# Altium project AthletiTech_V1.0.PrjPcb (part 1 of 4)
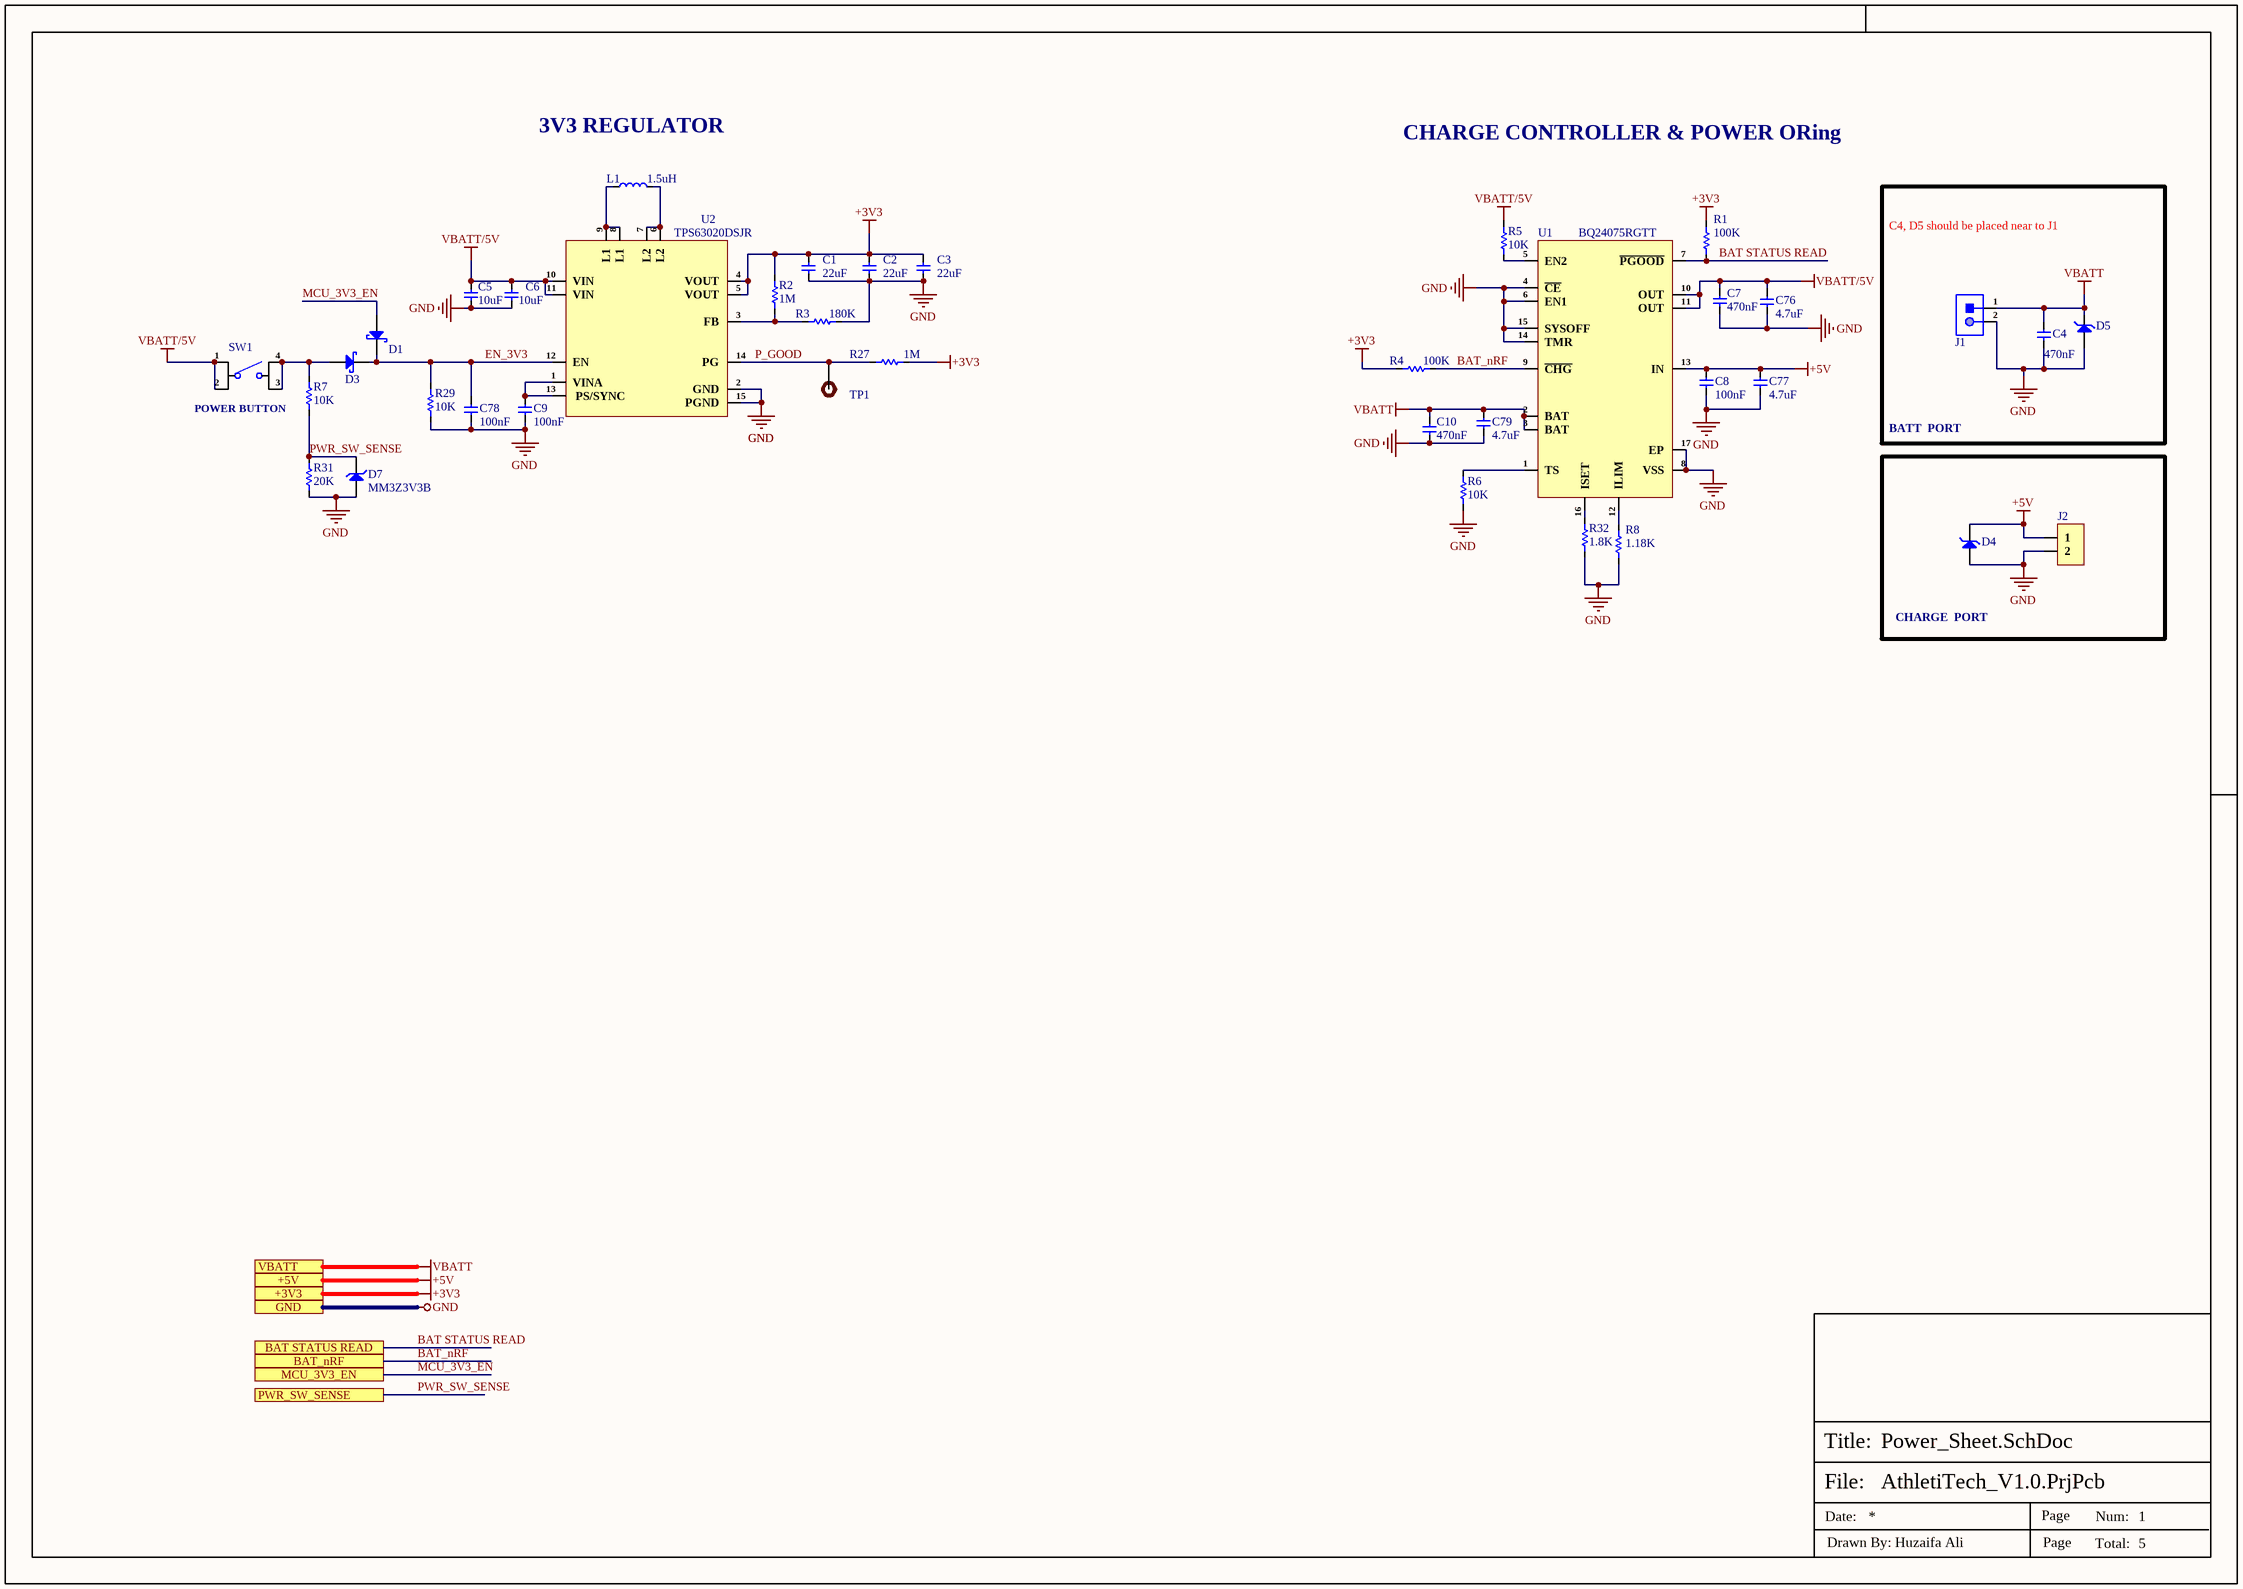
[diagram p0: Power_Sheet.SchDoc]
5 sheets, 178 parts. Net scope: flat (ports and power ports of the same name join across sheets).
Board file: AthetiTech_PCB_V1.0.PcbDoc
Sheets:
  Power_Sheet.SchDoc
  MCU_Sheet.SchDoc
  UWB_Sheet.SchDoc
  IMU_Sheet.SchDoc
  GPS_Sheet.SchDoc

## Sheet Power_Sheet.SchDoc
size 420 x 297 mm; SheetNumber: 1; SheetTotal: 5

### Parts
C1  22uF  [Cap-0603]
C2  22uF  [Cap-0603]
C3  22uF  [Cap-0603]
C4  470nF  [Cap-0402]
C5  10uF  [Cap-0603]
C6  10uF  [Cap-0603]
C7  470nF  [Cap-0402]
C8  100nF  [cap-0402]
C9  100nF  [cap-0402]
C10  470nF  [Cap-0402]
C76  4.7uF  [Cap-0402]
C77  4.7uF  [Cap-0402]
C78  100nF  [cap-0402]
C79  4.7uF  [Cap-0402]
D1  1SS404,H3F  [USC]  (value not drawn)
D3  1SS404,H3F  [USC]  (value not drawn)
D4  ESD9L5.0ST5G  [SOD-923.]  (value not drawn)
D5  ESD9L5.0ST5G  [SOD-923.]  (value not drawn)
D7  MM3Z3V3B  [SOD323F]
J1  S2B-ZR-3.4(LF)(SN)  [S2B-ZR-3.4(LF)(SN)]  (value not drawn)
J2  854-22-002-20-041101  [854-22-002-20-041101]  (value not drawn)
L1  1.5uH  [XFL4020-152MEC]
R1  100K  [Res-0402]
R2  1M  [Res-0402]
R3  180K  [Res-0402]
R4  100K  [Res-0402]
R5  10K  [Res-0402]
R6  10K  [Res-0402]
R7  10K  [Res-0402]
R8  1.18K  [Res-0402]
R27  1M  [Res-0402]
R29  10K  [Res-0402]
R31  20K  [Res-0402]
R32  1.8K  [Res-0402]
SW1  TS-1109S-C-B  [TS-1109S-C-B]  (value not drawn)
TP1  TEST POINT 0.5mm Dia  [Test-point - 0.5mm]  (value not drawn)  (no BOM)
U1  BQ24075RGTT  [VQFN-16(3x3)]
U2  TPS63020DSJR  [14-VSON (4x3)]

### Blocks framed on the sheet
CHARGE  PORT: D4 J2

### Ports
+3V3, +5V, BAT STATUS READ, BAT_nRF, GND, MCU_3V3_EN, PWR_SW_SENSE, VBATT

### Nets
+3V3: C1.2 C2.2 C3.2 R1.2 R2.2 R4.2 R27.1 U2.4(VOUT) U2.5(VOUT) ; port +3V3  [project net VDDAON]
+5V: C8.2 C77.2 D4.1(K) J2.1 U1.13(IN) ; port +5V
GND: C1.1 C2.1 C3.1 C4.2 C5.1 C6.1 C7.2 C8.1 C9.1 C10.2 C76.1 C77.1 C78.1 C79.1 D4.2(A) D5.2(A) D7.1(A) J1.2 J2.2 R3.1 R6.2 R8.1 R29.2 R31.1 R32.1 U1.4(~{CE}) U1.6(EN1) U1.8(VSS) U1.14(TMR) U1.15(SYSOFF) U1.17(EP) U2.2(GND) U2.15(PGND) ; port GND
VBATT: C4.1 C10.1 C79.2 D5.1(K) J1.1 U1.2(BAT) U1.3(BAT) ; port VBATT
VBATT/5V: C5.2 C6.2 C7.1 C76.2 R5.1 SW1.1 SW1.2 U1.10(OUT) U1.11(OUT) U2.10(VIN) U2.11(VIN)
BAT STATUS READ: R1.1 U1.7(~{PGOOD}) ; port BAT STATUS READ
BAT_nRF: R4.1 U1.9(~{CHG}) ; port BAT_nRF
EN_3V3: C78.2 D1.1(K) D3.1(K) R29.1 U2.12(EN)
MCU_3V3_EN: D1.2(A) ; port MCU_3V3_EN
P_GOOD: R27.2 TP1.1 U2.14(PG)
PWR_SW_SENSE: D7.2(K) R7.1 R31.2 ; port PWR_SW_SENSE
NetC9_2: C9.2 U2.1(VINA) U2.13(PS/SYNC)
NetD3_2: D3.2(A) R7.2 SW1.3 SW1.4
NetL1_1: L1.1 U2.8(L1) U2.9(L1)
NetL1_2: L1.2 U2.6(L2) U2.7(L2)
NetR2_1: R2.1 R3.2 U2.3(FB)
NetR5_2: R5.2 U1.5(EN2)
NetR6_1: R6.1 U1.1(TS)
NetR8_2: R8.2 U1.12(ILIM)
NetR32_2: R32.2 U1.16(ISET)

### Notes on the sheet
- (near L1) 3V3 REGULATOR
- CHARGE CONTROLLER & POWER ORing
- C4, D5 should be placed near to J1
- (near SW1) POWER BUTTON
- BATT  PORT
- File:
- Title:
- Date:
- Page
- Num:
- Total:
- Drawn By: Huzaifa Ali

### Library data of the parts
C1-C3 = CC0603MRX5R6BB226: CAP CER 22UF 10V X5R 0603; Manufacturer: Yageo; Tolerance: 20%; Item Type: Capacitor; Supplier 1: Digi-Key; Manufacturer Part Number: CC0603MRX5R6BB226; RoHS: Yes; Category: Ceramic Capacitors; Stock 1: 19628; Pricing 1: 1=0.68000, 10=0.48000, 50=0.36300, 100=0.31610, 500=0.23416, 1000=0.19903 (USD); Mount: Surface Mount; Case/Package: 0603; Case Code (Metric): 1608; Case Code (Imperial): 0603; Weight: 7.1E-05oz; Min Operating Temperature: -55°C; Max Operating Temperature: 85°C; Packaging: Tape and Reel; Capacitance: 22uF; Voltage Rating: 10V; Dielectric: X5R; Termination: SMD/SMT; Voltage Rating (DC): 10V; Package Quantity: 4000; Length: 0.063inch; Width: 0.8mm; Height: 0.8mm; Thickness: 0.035inch; Lead Free: Lead Free; Halogen Free: Halogen Free; RoHS Compliant: Yes; ComponentLink1URL: http://www.mouser.com/ds/2/447/Yageo_UPY-GP_NP0_16V-to-50V_9-358835.pdf?src-supplier=Mouser; ComponentLink1Description: http://www.mouser.com/ds/2/447/Yageo_UPY-GP_NP0_16V-to-50V_9-358835.pdf?src-supplier=Mouser; ComponentLink2URL: http://www.yageo.com/documents/recent/UPY-GPHC_X5R_4V-to-50V_25.pdf?src-supplier=Digi-Key; ComponentLink2Description: http://www.yageo.com/documents/recent/UPY-GPHC_X5R_4V-to-50V_25.pdf?src-supplier=Digi-Key; Supplier Part Number 1: 311-1819-1-ND; LCSC Part Number: C109447
C4 C7 C10 = CL05A474KA5NNNC: CAP CER 0.47UF 25V X5R 0402; Manufacturer: Samsung; Material: Ceramic; Tolerance: 10%; Supplier: Avnet; Supplier Part Number: CL05A474KA5NNNC; Manufacturer Part Number: CL05A474KA5NNNC; RoHS: Yes; Category: Ceramic Capacitors; Stock: 80000; Pricing: 100000=0.02563 (USD); Mounting Technology: Surface Mount; Case/Package: 0402; Case Code (Metric): 1005; Case Code (Imperial): 0402; Min Operating Temperature: -55°C; Max Operating Temperature: 85°C; Packaging: Cut Tape; Value: 470nF; Voltage Rating (DC): 25V; Voltage Rating: 25V; Series: CL; Height: 550um; Lead Free: Lead Free; RoHS Compliant: Yes; ComponentLink1URL: https://datasheet.ciiva.com/25796/cl05a474ka5nnnc-25796037.pdf?src-supplier=Digikey; ComponentLink1Description: https://datasheet.ciiva.com/25796/cl05a474ka5nnnc-25796037.pdf?src-supplier=Digikey; ComponentLink2URL: https://datasheet.ciiva.com/29198/458859-da-01-en-vs-kondensator-0402-29198303.pdf?src-supplier=Conrad; ComponentLink2Description: https://datasheet.ciiva.com/29198/458859-da-01-en-vs-kondensator-0402-29198303.pdf?src-supplier=Conrad
C5 C6 = GRT188R61E106ME13D: CAP CER 10UF 25V X5R 0603; Manufacturer: Murata; Item Type: Capacitors; Material: 4241ConductorMaterial; Tolerance: 20%; Supplier: Future Electronics; LCSC Part Number: C697423; Manufacturer Part Number: GRT188R61E106ME13D; RoHS: No; Stock: 444000; Pricing: 4000=0.0522, 8000=0.0514, 12000=0.0509, 20000=0.0503, 40000=0.049 (USD); Mounting Technology: Surface Mount; Case/Package: 0603; Case Code (Metric): 1608; Case Code (Imperial): 0603; Weight: 0.000917oz; Min Operating Temperature: -55°C; Max Operating Temperature: 85°C; Packaging: Cut Tape; Value: 10uF; Voltage Rating: 25V; Series: GRT; Termination: Standard; Voltage Rating (DC): 25V; Dielectric: X5R; Package Quantity: 4000; Length: 1.6mm; Width: 0.8mm; Height: 0.8mm; Ratings: AEC-Q200; RoHS Compliant: No; ComponentLink1URL: https://datasheet.octopart.com/GRT188R61E106ME13D-Murata-datasheet-149523595.pdf?src-supplier=Newark; ComponentLink1Description: https://datasheet.octopart.com/GRT188R61E106ME13D-Murata-datasheet-149523595.pdf?src-supplier=Newark; ComponentLink2URL: https://datasheet.octopart.com/GRT188R61E106ME13D-Murata-datasheet-82944876.pdf?src-supplier=Future+Electronics; ComponentLink2Description: https://datasheet.octopart.com/GRT188R61E106ME13D-Murata-datasheet-82944876.pdf?src-supplier=Future+Electronics; ComponentLink3URL: http://search.murata.co.jp/Ceramy/image/img/A01X/G101/ENG/GRT188R61E106ME13-01.pdf?src-supplier=Digikey; ComponentLink3Description: http://search.murata.co.jp/Ceramy/image/img/A01X/G101/ENG/GRT188R61E106ME13-01.pdf?src-supplier=Digikey; ComponentLink4URL: https://search.murata.co.jp/Ceramy/image/img/A01X/G101/ENG/GRT188R61E106ME13-01.pdf?src-supplier=Digikey; ComponentLink4Description: https://search.murata.co.jp/Ceramy/image/img/A01X/G101/ENG/GRT188R61E106ME13-01.pdf?src-supplier=Digikey; ComponentLink5URL: https://datasheet.octopart.com/GRT188R61E106ME13D-Murata-datasheet-165579666.pdf?src-supplier=TME; ComponentLink5Description: https://datasheet.octopart.com/GRT188R61E106ME13D-Murata-datasheet-165579666.pdf?src-supplier=TME
C8 C9 C78 = C1005X7R1H104KT000F: CAP CER 0.1UF 50V X7R 0402; Manufacturer: TDK; Tolerance: 10%; Voltage: 25V; Item Type: Capacitor; Supplier 1: Avnet; Manufacturer Part Number: C1005X7R1H104KT000F; RoHS: No; Category: Ceramic Capacitors; Dielectric: X7R; Supplier Part Number 1: C1005X7R1H104KT000F; LCSC Part Number: C361198; ComponentLink1Description: LCSC; ComponentLink1URL: https://www.lcsc.com/product-detail/Multilayer-Ceramic-Capacitors-MLCC-SMD-SMT_TDK-C1005X7R1H104KT000F_C361198.html
C76 C77 C79 = CL05A475MO5NUNC: CAP CER 4.7UF 16V X5R 0402; Manufacturer: Samsung; Material: 4241ConductorMaterial; Tolerance: 20%; Supplier 1: Avnet; Manufacturer Part Number: CL05A475MO5NUNC; RoHS: Yes; Category: Ceramic Capacitors; Stock 1: 50000; Pricing 1: 10000=0.09712 (USD); Mount: Surface Mount; Case/Package: 0402; Case Code (Metric): 1005; Case Code (Imperial): 0402; Min Operating Temperature: -55°C; Max Operating Temperature: 85°C; Packaging: Cut Tape; Capacitance: 4.7uF; Voltage Rating: 16V; Series: CL; Voltage Rating (DC): 16V; Length: 0.039inch; Width: 0.02inch; Height: 550um; Thickness: 0.022inch; RoHS Compliant: Yes; ComponentLink1URL: http://www.farnell.com/datasheets/2710653.pdf?src-supplier=Farnell; ComponentLink1Description: http://www.farnell.com/datasheets/2710653.pdf?src-supplier=Farnell; ComponentLink2URL: http://www.samsungsem.com/kr/support/product-search/mlcc/CL05A475MO5NUNC.jsp?src-supplier=Digikey; ComponentLink2Description: http://www.samsungsem.com/kr/support/product-search/mlcc/CL05A475MO5NUNC.jsp?src-supplier=Digikey; ComponentLink3URL: http://www.farnell.com/datasheets/2710653.pdf?src-supplier=Element14; ComponentLink3Description: http://www.farnell.com/datasheets/2710653.pdf?src-supplier=Element14; ComponentLink4URL: https://datasheet.octopart.com/CL05A475MO5NUNC-Samsung-Electro-Mechanics-datasheet-123102911.pdf?src-supplier=Future+Electronics; ComponentLink4Description: https://datasheet.octopart.com/CL05A475MO5NUNC-Samsung-Electro-Mechanics-datasheet-123102911.pdf?src-supplier=Future+Electronics; ComponentLink5URL: http://www.farnell.com/datasheets/2710653.pdf?src-supplier=Newark; ComponentLink5Description: http://www.farnell.com/datasheets/2710653.pdf?src-supplier=Newark; Supplier Part Number 1: CL05A475MO5NUNC
D1 D3 = 1SS404,H3F: Diode Schottky Barrier 25V 0.3A 2 SOD-323; Manufacturer: Toshiba; Average Rectified Current: 300mA; Max Reverse Voltage (DC): 20V; Supplier 1: Avnet; Manufacturer Part Number: 1SS404,H3F; RoHS: No; Category: Rectifier Diodes; Stock 1: 36000; Pricing 1: 3000=0.01778, 6000=0.01748, 12000=0.01718, 18000=0.01688, 24000=0.01658 (USD); Mount: Surface Mount; Case/Package: SOD; Contact Plating: Tin,Silver; Min Operating Temperature: -40°C; Max Operating Temperature: 100°C; Packaging: Cut Tape; Forward Current: 300mA; Max Repetitive Reverse Voltage (Vrrm): 25V; Series: -; ComponentLink1URL: https://datasheet.ciiva.com/45259/dst-1ss404-tde-en-1850-45259189.pdf?src-supplier=Digikey; ComponentLink1Description: https://datasheet.ciiva.com/45259/dst-1ss404-tde-en-1850-45259189.pdf?src-supplier=Digikey; ComponentLink2URL: https://datasheet.ciiva.com/45259/dst-1ss404-tde-en-1850-45259190.pdf?src-supplier=Digikey; ComponentLink2Description: https://datasheet.ciiva.com/45259/dst-1ss404-tde-en-1850-45259190.pdf?src-supplier=Digikey; ComponentLink3URL: https://datasheet.ciiva.com/45259/dst-1ss404-tde-en-1850-45259191.pdf?src-supplier=Digikey; ComponentLink3Description: https://datasheet.ciiva.com/45259/dst-1ss404-tde-en-1850-45259191.pdf?src-supplier=Digikey; Supplier Part Number 1: 1SS404,H3F; Item Type: Diode; LCSC Part Number: C146358
D4 D5 = ESD9L5.0ST5G: TVS DIODE 5V 9.8V SOD923; Manufacturer: ON Semiconductor; Capacitance: 0.9pF; Direction: Unidirectional; Number of Unidirectional Channels: 1; Min Breakdown Voltage: 5.4V; Power Line Protection: No; Leakage Current: 1uA; Element Configuration: Single; Peak Pulse Current: 1A; Diode Type: ZENER; Reverse Breakdown Voltage: 5.8V; Peak Pulse Power: 150mW; ESD Protection: Yes; Test Current: 1mA; Supplier 1: Digi-Key; Manufacturer Part Number: ESD9L5.0ST5G; RoHS: Yes; Category: ESD and Circuit Protection ICs; Stock 1: 558996; Pricing 1: 1=0.37000, 10=0.25600, 100=0.12500, 500=0.10426, 1000=0.07244, 2000=0.06278 (USD); Case/Package: SOD-923-2; Number of Pins: 2; Contact Plating: Tin,Matte; Min Operating Temperature: -55°C; Max Operating Temperature: 150°C; Package Quantity: 1; Packaging: Tape and Reel; Clamping Voltage: 9.8V; Reverse Standoff Voltage: 5V; Working Voltage: 5V; Resistor Type: Zener; Series: Automotive, AEC-Q101; Number of Elements: 1; Operating Supply Voltage: 5V; Max Surge Current: 1A; Breakdown Voltage: 5.4V; Number of Channels: 1; Polarity: Unidirectional; Termination: SMD/SMT; Max Reverse Leakage Current: 1uA; Max Breakdown Voltage: 5.4V; Number of Lines: 1; Power Dissipation: 150mW; Clamping Voltage-Max: 9.8V; Length: 0.8mm; Width: 0.65mm; Height: 0.4mm; Depth: 0.6mm; Radiation Hardening: No; Lead Free: Lead Free; RoHS Compliant: Yes; REACH SVHC: No SVHC; Halogen Free: Halogen Free; ComponentLink1URL: https://datasheet.ciiva.com/15143/getdatasheetpartid-185186-15143896.pdf?src-supplier=Verical; ComponentLink1Description: https://datasheet.ciiva.com/15143/getdatasheetpartid-185186-15143896.pdf?src-supplier=Verical; ComponentLink2URL: https://datasheet.ciiva.com/4510/esd9l-d-4510647.pdf?src-supplier=Mouser; ComponentLink2Description: https://datasheet.ciiva.com/4510/esd9l-d-4510647.pdf?src-supplier=Mouser; ComponentLink3URL: https://datasheet.ciiva.com/3304/esd9l-d-3304011.pdf?src-supplier=Avnet; ComponentLink3Description: https://datasheet.ciiva.com/3304/esd9l-d-3304011.pdf?src-supplier=Avnet; ComponentLink4URL: https://datasheet.ciiva.com/16437/esd9l-d-16437835.pdf?src-supplier=Future+Electronics; ComponentLink4Description: https://datasheet.ciiva.com/16437/esd9l-d-16437835.pdf?src-supplier=Future+Electronics; ComponentLink5URL: https://datasheet.ciiva.com/339/esd9l-d-339853.pdf?src-supplier=Digi-Key; ComponentLink5Description: https://datasheet.ciiva.com/339/esd9l-d-339853.pdf?src-supplier=Digi-Key; ComponentLink6URL: https://datasheet.ciiva.com/339/esd9l-d-339854.pdf?src-supplier=Digi-Key; ComponentLink6Description: https://datasheet.ciiva.com/339/esd9l-d-339854.pdf?src-supplier=Digi-Key; ComponentLink7URL: https://datasheet.ciiva.com/11195/esd9l-d-11195342.pdf?src-supplier=Avnet; ComponentLink7Description: https://datasheet.ciiva.com/11195/esd9l-d-11195342.pdf?src-supplier=Avnet; ComponentLink8URL: https://datasheet.ciiva.com/25958/esd9l-d-25958446.pdf?src-supplier=Avnet+Europe; ComponentLink8Description: https://datasheet.ciiva.com/25958/esd9l-d-25958446.pdf?src-supplier=Avnet+Europe; ComponentLink9URL: https://datasheet.ciiva.com/339/esd9l-d-339855.pdf?src-supplier=Digi-Key; ComponentLink9Description: https://datasheet.ciiva.com/339/esd9l-d-339855.pdf?src-supplier=Digi-Key; Supplier Part Number 1: ESD9L5.0ST5GOSCT-ND; LCSC Part Number: C82326
D7 = MM3Z3V3B: DIODE ZENER 3.3V 200MW SOD323F; Manufacturer: ON Semiconductor / Fairchild; Forward Voltage: 1V; Tolerance: 2%; Impedance: 89R; Max Reverse Leakage Current: 4.5uA; Test Current: 5mA; Element Configuration: Single; Supplier 1: Digi-Key; Manufacturer Part Number: MM3Z3V3B; Stock 1: 473644; Pricing 1: 1=0.22, 10=0.18, 100=0.0956, 500=0.06288, 1000=0.04276 (USD); Mount: Surface Mount; Number of Pins: 2; Weight: 0.0276g; Min Operating Temperature: -65°C; Max Operating Temperature: 150°C; Packaging: Tape and Reel; Package Quantity: 1; Max Power Dissipation: 200mW; Zener Voltage: 3.3V; Voltage Tolerance: 2%; Power Dissipation: 200mW; Working Voltage: 3.3V; Peak Reverse Current: 4.5uA; Length: 1.3mm; Height: 1mm; Width: 1.7mm; Radiation Hardening: No; REACH SVHC: No SVHC; Lead Free: Lead Free; ComponentLink1URL: http://www.onsemi.com/pub/Collateral/MM3Z9V1B-D.pdf?src-supplier=Digi-Key; ComponentLink1Description: http://www.onsemi.com/pub/Collateral/MM3Z9V1B-D.pdf?src-supplier=Digi-Key; ComponentLink2URL: http://www.mouser.com/ds/2/149/MM3Z3V3B-187166.pdf?src-supplier=Mouser; ComponentLink2Description: http://www.mouser.com/ds/2/149/MM3Z3V3B-187166.pdf?src-supplier=Mouser; ComponentLink3URL: https://www.fairchildsemi.com/datasheets/MM/MM3Z9V1B.pdf?src-supplier=Avnet; ComponentLink3Description: https://www.fairchildsemi.com/datasheets/MM/MM3Z9V1B.pdf?src-supplier=Avnet; ComponentLink4URL: http://www.farnell.com/datasheets/1706525.pdf?src-supplier=Element14; ComponentLink4Description: http://www.farnell.com/datasheets/1706525.pdf?src-supplier=Element14; Supplier Part Number 1: MM3Z3V3BCT-ND; LCSC Part Number: C2978865; Item Type: Diode
J1 = S2B-ZR-3.4(LF)(SN): CONN HEADER R/A 2POS 1.5MM; Manufacturer: JST; Item Type: Connectors; Supplier: Future Electronics; LCSC Part Number: C160729; Manufacturer Part Number: S2B-ZR-3.4(LF)(SN); RoHS: Yes; Pricing: 2000=0.0671, 4000=0.0659, 8000=0.0648, 10000=0.0645, 30000=0.0623 (USD)
J2 = 854-22-002-20-041101: 2 Position Spring Piston Connector Through Hole, Right Angle; Manufacturer: Mill-Max; Item Type: Spring Loaded; Supplier: Digikey; Supplier Part Number: 54-854-22-002-20-041101-ND; Manufacturer Part Number: 854-22-002-20-041101; RoHS: No; Pricing: 1=3.53, 10=3.002, 25=2.8136, 50=2.679, 100=2.551, 250=2.39124, 500=2.27716, 1000=2.16851, 2500=2.03287 (USD)
L1 = XFL4020-152MEC: FIXED IND 1.5UH 9.1A 15.8MOHM SM; Manufacturer: Coilcraft; Item Type: Inductors; ESR: 15.8mR; Supplier: Mouser; LCSC Part Number: C3033018; Manufacturer Part Number: XFL4020-152MEC; RoHS: Yes; Stock: 9871; Pricing: 1=3.04, 10=2.59, 50=2.39, 100=1.78, 1000=1.23, 10000=1.23 (USD); ComponentLink1URL: https://datasheet.ciiva.com/13168/xfl4020-13168080.pdf?src-supplier=Mouser; ComponentLink1Description: https://datasheet.ciiva.com/13168/xfl4020-13168080.pdf?src-supplier=Mouser; ComponentLink2URL: https://datasheet.ciiva.com/22679/1682010-22679275.pdf?src-supplier=Element14; ComponentLink2Description: https://datasheet.ciiva.com/22679/1682010-22679275.pdf?src-supplier=Element14; ComponentLink3URL: https://datasheet.ciiva.com/22679/1682010-22679276.pdf?src-supplier=Element14; ComponentLink3Description: https://datasheet.ciiva.com/22679/1682010-22679276.pdf?src-supplier=Element14
R1 R4 = RC0402FR-07100KL: RES 100K OHM 1% 1/16W 0402; Manufacturer: Yageo; Resistance: 100kR; Temperature Coefficient: 100ppm/°C; Power Rating: 63mW; Voltage Rating: 50V; Item Type: Resistor; Supplier 1: Mouser; Manufacturer Part Number: RC0402FR-07100KL; RoHS: Yes; Category: Chip SMD Resistors; Stock 1: 7759549; Pricing 1: 1=0.10000, 10=0.01200, 50=0.01200, 100=0.00500, 1000=0.00300, 2500=0.00200, 10000=0.00100 (USD); Case/Package: 0402; Case Code (Metric): 1005; Case Code (Imperial): 0402; Min Operating Temperature: -55°C; Max Operating Temperature: 155°C; Resistor Type: Thick Film; Tolerance: 1%; Packaging: Tape and Reel; Package Quantity: 1; Number of Terminations: 2; Termination: SMD/SMT; Max Power Dissipation: 63mW; Working Voltage: 50V; Features: Moisture Resistant; Series: RC; Resistance Tolerance: 1%; Construction: Rectangular; Technology: THICK FILM; Length: 0.039inch; Width: 0.02inch; Height: 0.016inch; Depth: 0.5mm; REACH SVHC: No SVHC; Lead Free: Lead Free; RoHS Compliant: Yes; Military Standard: Not; ComponentLink1URL: https://datasheet.ciiva.com/11819/0900766b80c66297-11819452.pdf?src-supplier=RSComponents; ComponentLink1Description: https://datasheet.ciiva.com/11819/0900766b80c66297-11819452.pdf?src-supplier=RSComponents; ComponentLink2URL: https://datasheet.ciiva.com/22747/1018594-22747509.pdf?src-supplier=Element14; ComponentLink2Description: https://datasheet.ciiva.com/22747/1018594-22747509.pdf?src-supplier=Element14; ComponentLink3URL: https://datasheet.ciiva.com/2453/pyu-r-int-thick-7-2453362.pdf?src-supplier=Digi-Key; ComponentLink3Description: https://datasheet.ciiva.com/2453/pyu-r-int-thick-7-2453362.pdf?src-supplier=Digi-Key; ComponentLink4URL: https://datasheet.ciiva.com/2453/pyu-r-int-thick-7-2453363.pdf?src-supplier=Digi-Key; ComponentLink4Description: https://datasheet.ciiva.com/2453/pyu-r-int-thick-7-2453363.pdf?src-supplier=Digi-Key; ComponentLink5URL: https://datasheet.ciiva.com/2453/pyu-r-int-thick-7-2453361.pdf?src-supplier=Digi-Key; ComponentLink5Description: https://datasheet.ciiva.com/2453/pyu-r-int-thick-7-2453361.pdf?src-supplier=Digi-Key; ComponentLink6URL: https://datasheet.ciiva.com/12667/pyu-rc0402-51-rohs-l-6-r-12667930.pdf?src-supplier=Mouser; ComponentLink6Description: https://datasheet.ciiva.com/12667/pyu-rc0402-51-rohs-l-6-r-12667930.pdf?src-supplier=Mouser; ComponentLink7URL: https://datasheet.ciiva.com/15189/getdatasheetpartid-323696-15189334.pdf?src-supplier=Verical; ComponentLink7Description: https://datasheet.ciiva.com/15189/getdatasheetpartid-323696-15189334.pdf?src-supplier=Verical; Supplier Part Number 1: 603-RC0402FR-07100KL; LCSC Part Number: C60491
R2 R27 = AF0402JR-071ML: RES SMD 1M OHM 5% 1/16W 0402; Manufacturer: Yageo; Resistance: 1MR; Max Power Dissipation: 63mW; Temperature Coefficient: 100ppm/°C; Item Type: Resistor; Supplier 1: Digi-Key; Manufacturer Part Number: AF0402JR-071ML; Stock 1: 0; Pricing 1: 10000=0.00408 (USD); Case/Package: 0402; Min Operating Temperature: -55°C; Max Operating Temperature: 155°C; Packaging: Tape and Reel; Resistor Type: Thick Film; Number of Terminations: 2; Tolerance: 5%; Features: Moisture Resistant,Anti-Sulfur; Length: 0.039inch; Width: 0.02inch; Height: 0.015inch; RoHS Compliant: Yes; ComponentLink1URL: https://www.yageo.com/upload/media/product/productsearch/datasheet/rchip/PYu-AF_51_RoHS_L_6.pdf?src-supplier=Digi-Key; ComponentLink1Description: https://www.yageo.com/upload/media/product/productsearch/datasheet/rchip/PYu-AF_51_RoHS_L_6.pdf?src-supplier=Digi-Key; Supplier Part Number 1: AF0402JR-071ML-ND; LCSC Part Number: C144054
R3 = RT0402BRD07180KL: RES 180K OHM 0.1% 1/16W 0402; Manufacturer: Yageo; Value: 180kR; Max Power Dissipation: 63mW; Temperature Coefficient: 25ppm/°C; Item Type: Resistor; Supplier: Mouser; Supplier Part Number: 603-RT0402BRD07180KL; Manufacturer Part Number: RT0402BRD07180KL; RoHS: Yes; Category: Chip SMD Resistors; Stock: 23360; Pricing: 1=0.44, 10=0.324, 50=0.324, 100=0.129, 1000=0.064, 10000=0.051 (USD); Case/Package: 0402; Min Operating Temperature: -55°C; Max Operating Temperature: 155°C; Packaging: Tape and Reel; Tolerance: 0.1%; Number of Terminations: 2; Series: RT; RoHS Compliant: Yes; ComponentLink1URL: http://www.yageo.com/documents/recent/PYu-RT_1-to-0.01_RoHS_L_9.pdf?src-supplier=Digi-Key; ComponentLink1Description: http://www.yageo.com/documents/recent/PYu-RT_1-to-0.01_RoHS_L_9.pdf?src-supplier=Digi-Key; LCSC Part Number: C852573
R5 R6 R29 = RC0402FR-0710KL: RES 10K OHM 1% 1/16W 0402; Manufacturer: Yageo; Resistance: 10kR; Voltage Rating (DC): 50V; Temperature Coefficient: 100ppm/°C; Power Rating: 62.5mW; Max Power Dissipation: 63mW; Item Type: Resistor; Supplier 1: Mouser; Manufacturer Part Number: RC0402FR-0710KL; RoHS: Yes; Category: Chip SMD Resistors; Stock 1: 18648329; Pricing 1: 1=0.10000, 10=0.01400, 50=0.01400, 100=0.00500, 1000=0.00300, 10000=0.00200 (USD); Case/Package: 0402; Number of Pins: 2; Case Code (Imperial): 0402; Case Code (Metric): 1005; Min Operating Temperature: -55°C; Max Operating Temperature: 155°C; Resistor Type: Thick Film; Tolerance: 1%; Packaging: Tape and Reel; Voltage Rating: 50V; Termination: SMD/SMT; Working Voltage: 50V; Number of Terminations: 2; Features: Moisture Resistant; Series: RC; Resistance Tolerance: 1%; Construction: Rectangular; Length: 1mm; Width: 0.5mm; Height: 0.32mm; Depth: 0.5mm; Lead Pitch: 0.2mm; REACH SVHC: No SVHC; Lead Free: Lead Free; RoHS Compliant: Yes; Military Standard: Not; ComponentLink1URL: https://datasheet.ciiva.com/7660/38568-7660787.pdf?src-supplier=Element14; ComponentLink1Description: https://datasheet.ciiva.com/7660/38568-7660787.pdf?src-supplier=Element14; ComponentLink2URL: https://datasheet.ciiva.com/7849/1686128-7849814.pdf?src-supplier=Element14; ComponentLink2Description: https://datasheet.ciiva.com/7849/1686128-7849814.pdf?src-supplier=Element14; ComponentLink3URL: https://datasheet.ciiva.com/7983/1018594-7983486.pdf?src-supplier=Element14; ComponentLink3Description: https://datasheet.ciiva.com/7983/1018594-7983486.pdf?src-supplier=Element14; ComponentLink4URL: https://datasheet.ciiva.com/22747/1018594-22747512.pdf?src-supplier=Element14; ComponentLink4Description: https://datasheet.ciiva.com/22747/1018594-22747512.pdf?src-supplier=Element14; ComponentLink5URL: https://datasheet.ciiva.com/12667/pyu-rc0402-51-rohs-l-6-r-12667067.pdf?src-supplier=Mouser; ComponentLink5Description: https://datasheet.ciiva.com/12667/pyu-rc0402-51-rohs-l-6-r-12667067.pdf?src-supplier=Mouser; ComponentLink6URL: https://datasheet.ciiva.com/7849/1784430-7849813.pdf?src-supplier=Element14; ComponentLink6Description: https://datasheet.ciiva.com/7849/1784430-7849813.pdf?src-supplier=Element14; ComponentLink7URL: https://datasheet.ciiva.com/7849/1784430-7849815.pdf?src-supplier=Element14; ComponentLink7Description: https://datasheet.ciiva.com/7849/1784430-7849815.pdf?src-supplier=Element14; Supplier Part Number 1: 603-RC0402FR-0710KL; LCSC Part Number: C60490
R7 = RE0402DRE0710KL: RES SMD 10K OHM 0.5% 1/16W 0402; Manufacturer: Yageo; Value: 10kR; Max Power Dissipation: 63mW; Temperature Coefficient: 50ppm/°C; Item Type: Resistor; Supplier: Future Electronics; Supplier Part Number: 8132697; Manufacturer Part Number: RE0402DRE0710KL; RoHS: Yes; Category: Chip SMD Resistors; Stock: 10000; Pricing: 10000=0.0059, 40000=0.0056, 150000=0.0053, 250000=0.0052, 500000=0.0049 (USD); Case/Package: 0402; Min Operating Temperature: -55°C; Max Operating Temperature: 155°C; Packaging: Tape and Reel; Number of Terminations: 2; Tolerance: 0.5%; Features: Moisture Resistant; Series: RE; Length: 0.039inch; Width: 0.02inch; Height: 0.015inch; RoHS Compliant: Yes; ComponentLink1URL: http://www.yageo.com/NewPortal/yageodocoutput?fileName=/pdf/R-Chip/PYu-RE_105_RoHS_L_6.pdf&src-supplier=Digi-Key; ComponentLink1Description: http://www.yageo.com/NewPortal/yageodocoutput?fileName=/pdf/R-Chip/PYu-RE_105_RoHS_L_6.pdf&src-supplier=Digi-Key; LCSC Part Number: C851874
R8 = RT0402BRD071K18L: RES SMD 1.18KOHM 0.1% 1/16W 0402; Manufacturer: Yageo; Item Type: Resistors; Supplier: Avnet; LCSC Part Number: C852601; Manufacturer Part Number: RT0402BRD071K18L; RoHS: Yes; Stock: 10000; Pricing: 10000=0.01384 (USD); ComponentLink1URL: https://datasheet.ciiva.com/2582/pyu-rt-1-to-0-05-rohs-l-4-2582193.pdf?src-supplier=Digikey; ComponentLink1Description: https://datasheet.ciiva.com/2582/pyu-rt-1-to-0-05-rohs-l-4-2582193.pdf?src-supplier=Digikey; ComponentLink2URL: https://datasheet.ciiva.com/46635/pyu-rt-1-to-0-05-rohs-l-5-46635161.pdf?src-supplier=Digikey; ComponentLink2Description: https://datasheet.ciiva.com/46635/pyu-rt-1-to-0-05-rohs-l-5-46635161.pdf?src-supplier=Digikey
R31 = RT0402BRD0720KL: RES SMD 20K OHM 0.1% 1/16W 0402; Manufacturer: Yageo; Value: 20kR; Power Rating: 62.5mW; Voltage Rating: 50V; Max Power Dissipation: 63mW; Temperature Coefficient: 25ppm/°C; Item Type: Resistor; Supplier: Digikey; Supplier Part Number: YAG1388CT-ND; Manufacturer Part Number: RT0402BRD0720KL; RoHS: Yes; Category: Chip SMD Resistors; Stock: 80617; Pricing: 1=0.16, 10=0.121, 50=0.0958, 100=0.0859, 500=0.0654, 1000=0.0578, 5000=0.04283 (USD); Case/Package: 0402; Case Code (Imperial): 0402; Case Code (Metric): 1005; Weight: 2.3E-05oz; Contact Plating: Tin,Matte; Min Operating Temperature: -55°C; Max Operating Temperature: 125°C; Packaging: Tape and Reel; Tolerance: 0.1%; Package Quantity: 10000; Number of Terminations: 2; Termination: SMD/SMT; Voltage Rating (DC): 50V; Features: Moisture Resistant; Series: RT; Length: 0.039inch; Width: 0.5mm; Height: 0.014inch; Lead Free: Lead Free; RoHS Compliant: Yes; ComponentLink1URL: https://datasheet.ciiva.com/8890/pyu-rt-1-to-0-05-rohs-l-4-8890380.pdf?src-supplier=Avnet; ComponentLink1Description: https://datasheet.ciiva.com/8890/pyu-rt-1-to-0-05-rohs-l-4-8890380.pdf?src-supplier=Avnet; LCSC Part Number: C705630
R32 = RCS04021K80FKED: RES SMD 1.8K OHM 1% 1/5W 0402; Manufacturer: Vishay Dale; Resistance: 1.8kR; Max Power Dissipation: 200mW; Temperature Coefficient: 100ppm/°C; Supplier 1: Digi-Key; Manufacturer Part Number: RCS04021K80FKED; Stock 1: 1940; Pricing 1: 1=0.12, 10=0.105, 100=0.0402, 1000=0.01771, 2500=0.0153, 5000=0.01368 (USD); Case/Package: 0402; Min Operating Temperature: -55°C; Max Operating Temperature: 155°C; Package Quantity: 10000; Packaging: Tape and Reel; Resistor Type: Thick Film; Number of Terminations: 2; Tolerance: 1%; Features: Automotive AEC-Q200; Length: 0.039inch; Width: 0.02inch; Height: 0.016inch; ComponentLink1URL: http://www.vishay.com/docs/20065/rcse3.pdf?src-supplier=Digi-Key; ComponentLink1Description: http://www.vishay.com/docs/20065/rcse3.pdf?src-supplier=Digi-Key; Supplier Part Number 1: 541-RCS04021K80FKEDDKR-ND; LCSC Part Number: C1881088
SW1 = TS-1109S-C-B: No NO 50mA 4.5mm 100000 260gf 12V -30℃~+85℃ 4.5mm 4.3mm Black Round Button Brick nogging SPST SMD Tactile Switches ROHS; Manufacturer: XKB Connectivity; Item Type: Switch; Manufacturer Part Number: TS-1109S-C-B; Package: Custom; LCSC Part Number: C381037; ComponentLink1Description: LCSC; ComponentLink1URL: https://www.lcsc.com/product-detail/Tactile-Switches_XKB-Connectivity-TS-1109S-C-B_C381037.html
TP1 = TEST POINT 0.5mm Dia: Test Point ON; Item Type: Test Point; Manufacturer Part Number: TEST POINT 0.5mm Dia
U1 = BQ24075RGTT: IC BATT CHG LI-ION 1CELL 16QFN; Manufacturer: Texas Instruments; Supplier: Mouser; LCSC Part Number: C2865459; Manufacturer Part Number: BQ24075RGTT; RoHS: Yes; Item Type: IC; Stock: 350; Pricing: 1=2.63, 10=1.96, 50=1.8, 100=1.61, 1000=1.38, 10000=1.3 (USD); ComponentLink1URL: https://datasheet.ciiva.com/15114/getdatasheetpartid-313264-15114609.pdf?src-supplier=Verical; ComponentLink1Description: https://datasheet.ciiva.com/15114/getdatasheetpartid-313264-15114609.pdf?src-supplier=Verical; ComponentLink2URL: https://datasheet.ciiva.com/1932/bq24072-1932354.pdf?src-supplier=Digikey; ComponentLink2Description: https://datasheet.ciiva.com/1932/bq24072-1932354.pdf?src-supplier=Digikey; ComponentLink3URL: https://datasheet.ciiva.com/1932/bq24072-1932355.pdf?src-supplier=Digikey; ComponentLink3Description: https://datasheet.ciiva.com/1932/bq24072-1932355.pdf?src-supplier=Digikey; ComponentLink4URL: https://datasheet.ciiva.com/1932/bq24072-1932356.pdf?src-supplier=Digikey; ComponentLink4Description: https://datasheet.ciiva.com/1932/bq24072-1932356.pdf?src-supplier=Digikey; ComponentLink5URL: https://datasheet.ciiva.com/3214/bq24079-3214045.pdf?src-supplier=Avnet; ComponentLink5Description: https://datasheet.ciiva.com/3214/bq24079-3214045.pdf?src-supplier=Avnet; ComponentLink6URL: https://datasheet.ciiva.com/1136/1857100-1136583.pdf?src-supplier=Element14; ComponentLink6Description: https://datasheet.ciiva.com/1136/1857100-1136583.pdf?src-supplier=Element14; ComponentLink7URL: https://datasheet.ciiva.com/46397/1885912-46397205.pdf?src-supplier=Element14; ComponentLink7Description: https://datasheet.ciiva.com/46397/1885912-46397205.pdf?src-supplier=Element14
U2 = TPS63020DSJR: IC REG BUCK-BST ADJ 3.5A 14VSON; Manufacturer: Texas Instruments; Min Supply Voltage: 1.8V; Number of Outputs: 1; Output Voltage: 5.5V; Output Current: 3A; Efficiency: 96%; Switching Frequency: 2.4MHz; Min Output Voltage: 1.2V; Synchronous Rectifier: Yes; Quiescent Current: 50uA; Topology: Buck-Boost; Output Type: Adjustable; Output Configuration: Positive; Supplier: Mouser; Supplier Part Number: 595-TPS63020DSJR; Manufacturer Part Number: TPS63020DSJR; RoHS: Yes; Category: Voltage Regulators - Switching; Stock: 18181; Pricing: 1=2.8, 10=2.43, 50=2.43, 100=2.07, 1000=1.46, 10000=1.36 (USD); Mounting Technology: Surface Mount; Case/Package: VSON; Pins: 14; Min Operating Temperature: -40°C; Max Operating Temperature: 85°C; Package Quantity: 3000; Packaging: Tape and Reel; Min Input Voltage: 1.8V; Max Output current: 3A; Max Supply Voltage: 5.5V; Max Output Voltage: 5.5V; Operating Supply Voltage: 5.5V; Series: -; Supply Current: 50uA; Reach SVHC Compliant: No; Lead Free: Lead Free; RoHS Compliant: Yes; ComponentLink1URL: https://datasheet.ciiva.com/29733/tps63021-29733058.pdf?src-supplier=Digi-Key; ComponentLink1Description: https://datasheet.ciiva.com/29733/tps63021-29733058.pdf?src-supplier=Digi-Key; ComponentLink2URL: https://datasheet.ciiva.com/29733/tps63020-29733142.pdf?src-supplier=Digi-Key; ComponentLink2Description: https://datasheet.ciiva.com/29733/tps63020-29733142.pdf?src-supplier=Digi-Key; ComponentLink3URL: https://datasheet.ciiva.com/3221/tps63020-3221509.pdf?src-supplier=Avnet; ComponentLink3Description: https://datasheet.ciiva.com/3221/tps63020-3221509.pdf?src-supplier=Avnet; LCSC Part Number: C15483; Item Type: IC

## Sheet MCU_Sheet.SchDoc
size 420 x 297 mm; SheetNumber: 2; SheetTotal: 5
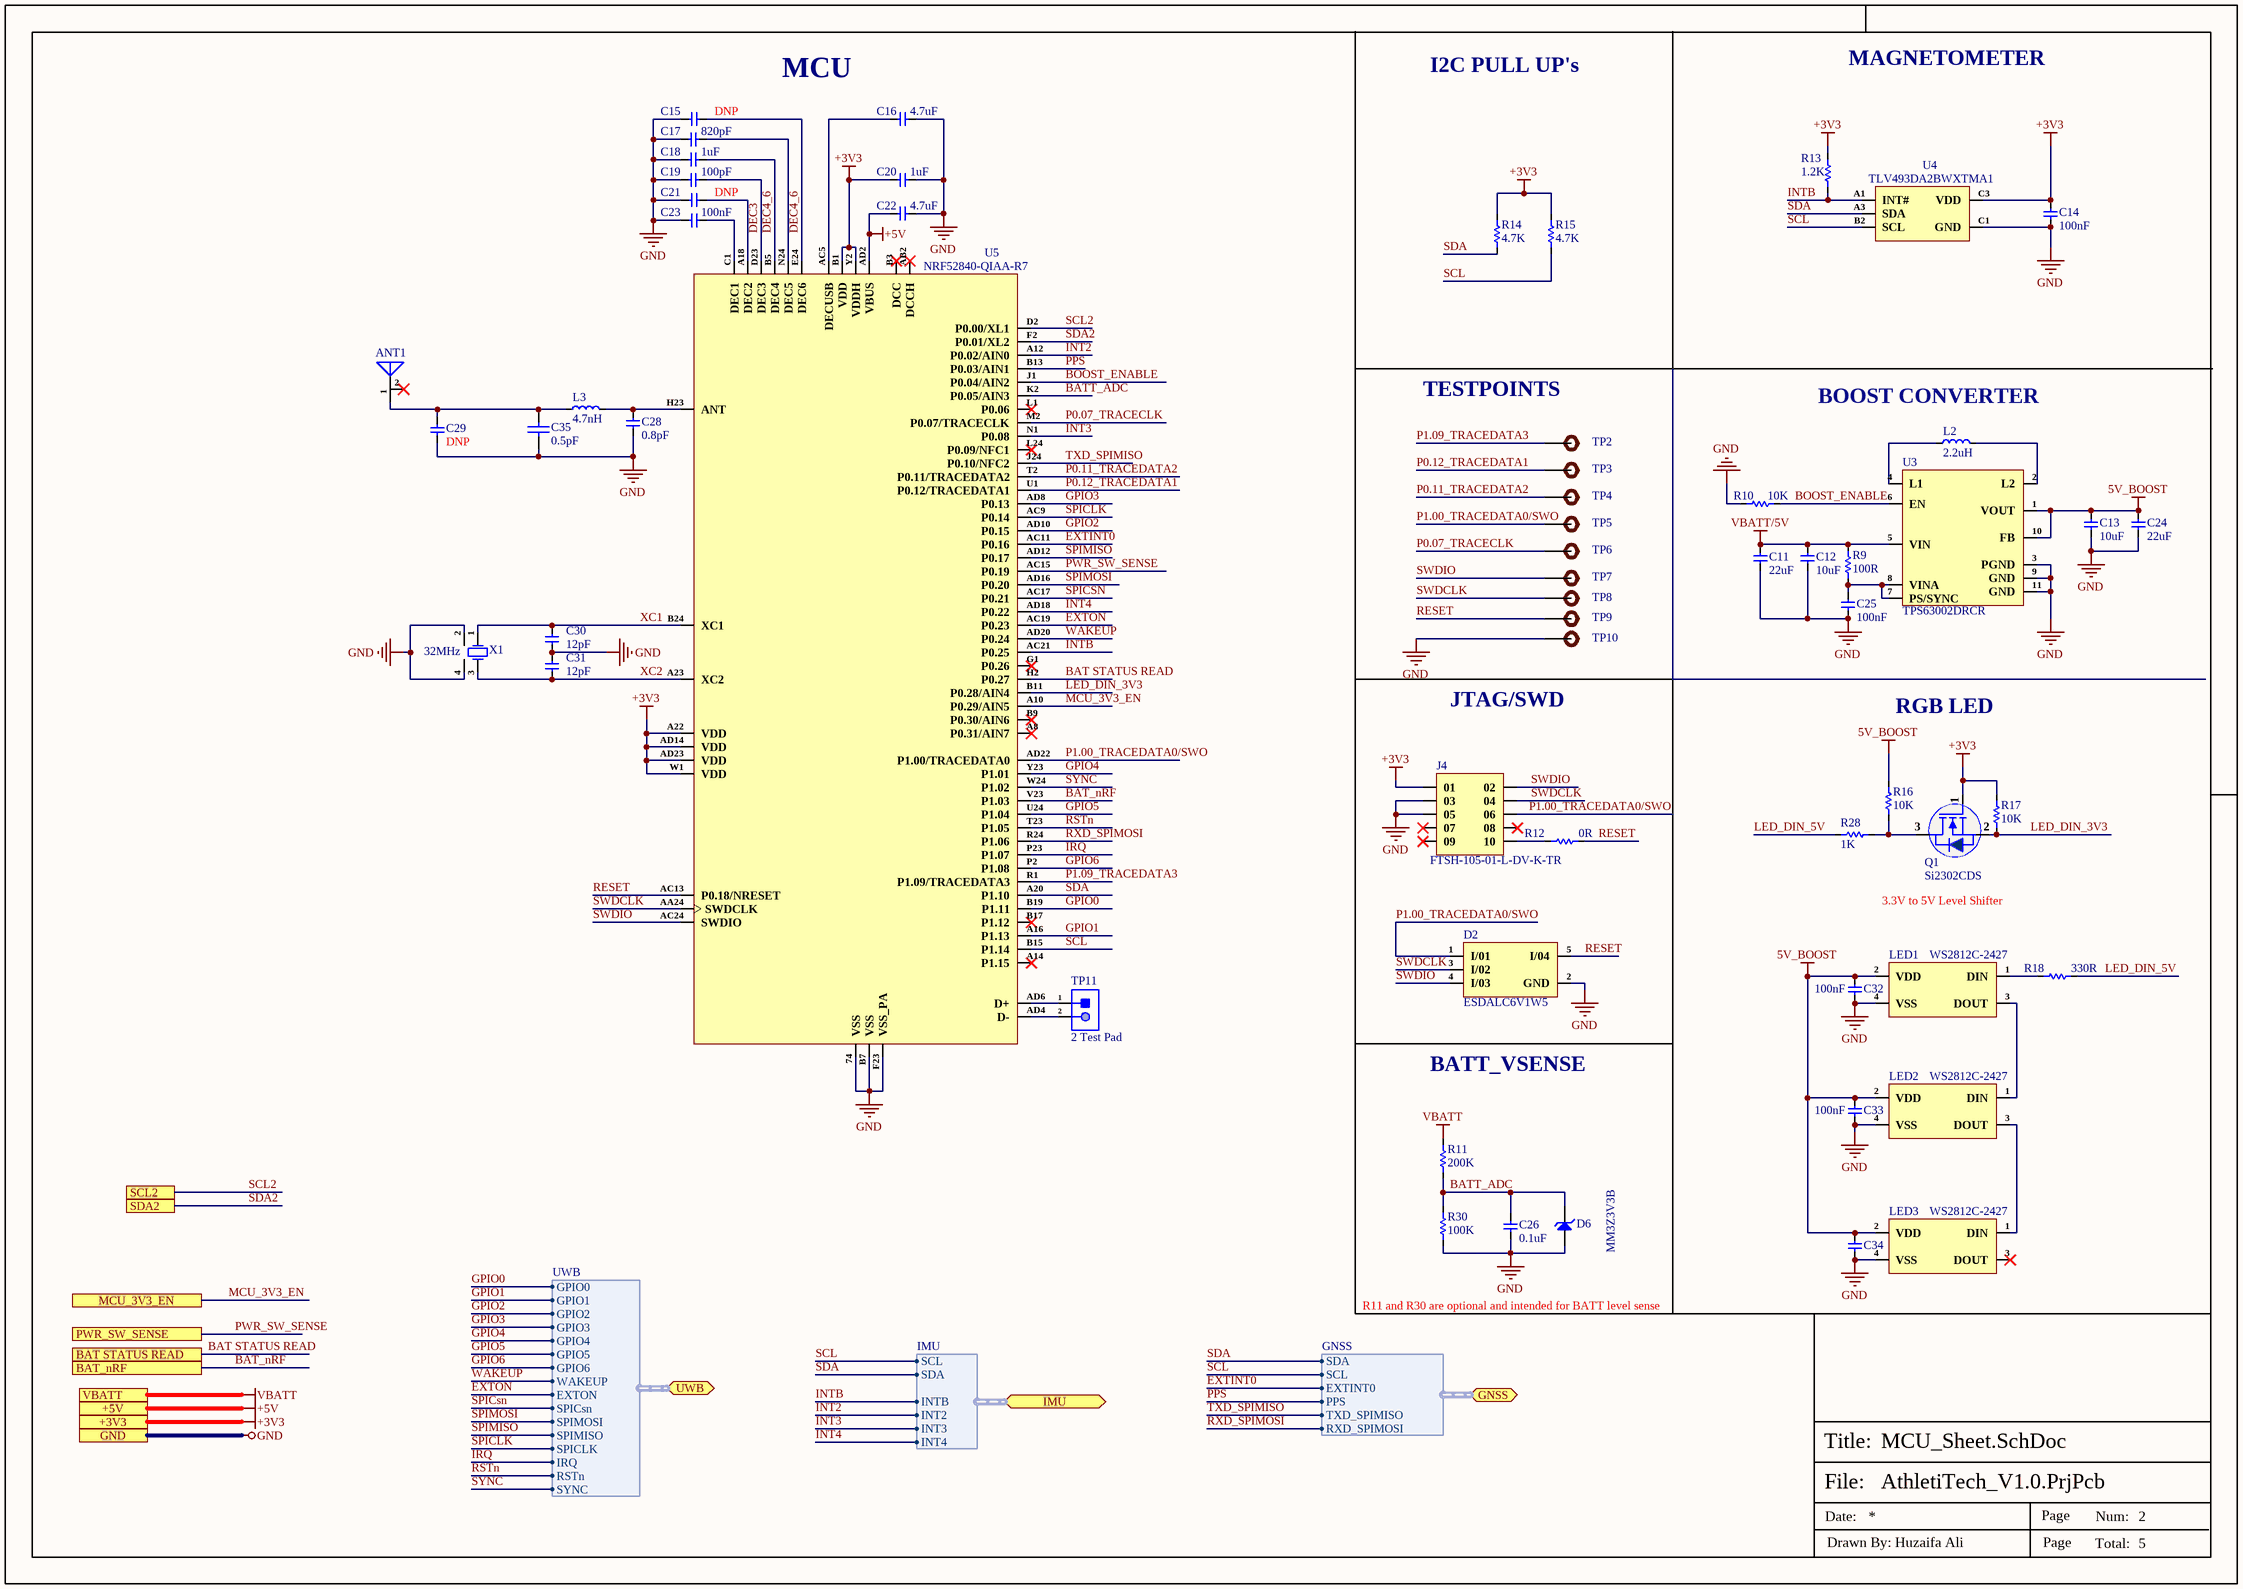
[diagram p1: MCU_Sheet.SchDoc]

### Parts
ANT1  2450AT18B100E  [ANT-1206]  (value not drawn)
C11  22uF  [Cap-0603]
C12  10uF  [Cap-0603]
C13  10uF  [Cap-0603]
C14  100nF  [cap-0402]
C15  DNP  [CAP-0201]
C16  4.7uF  [Cap-0402]
C17  820pF  [CAP-0201]
C18  1uF  [Cap-0402]
C19  100pF  [Cap-0402]
C20  1uF  [Cap-0402]
C21  DNP  [CAP-0201]
C22  4.7uF  [Cap-0402]
C23  100nF  [cap-0402]
C24  22uF  [Cap-0603]
C25  100nF  [cap-0402]
C26  0.1uF  [Cap-0402]
C28  0.8pF  [Cap-0402]
C29  DNP  [Cap-0402]
C30  12pF  [Cap-0402]
C31  12pF  [Cap-0402]
C32  100nF  [cap-0402]
C33  100nF  [cap-0402]
C34  100nF  [cap-0402]  (value not drawn)
C35  0.5pF  [CAPC1005X55X25NL05T10]
D2  ESDALC6V1W5  [SOT-323-5]
D6  MM3Z3V3B  [SOD323F]
J4  FTSH-105-01-L-DV-K-TR  [FTSH-105-01-L-DV-K-TR]
L2  2.2uH  [LQH3NPN2R2MJRL]
L3  4.7nH  [IND-0402]
LED1  WS2812C-2427  [WS2812C-2427]
LED2  WS2812C-2427  [WS2812C-2427]
LED3  WS2812C-2427  [WS2812C-2427]
Q1  Si2302CDS  [Sot-23]
R9  100R  [Res-0402]
R10  10K  [Res-0402]
R11  200K  [Res-0402]
R12  0R  [Res-0402]
R13  1.2K  [Res-0402]
R14  4.7K  [Res-0402]
R15  4.7K  [Res-0402]
R16  10K  [Res-0402]
R17  10K  [Res-0402]
R18  330R  [Res-0402]
R28  1K  [Res-0402]
R30  100K  [Res-0402]
TP2  TEST POINT 0.5mm Dia  [Test-point - 0.5mm]  (value not drawn)  (no BOM)
TP3  TEST POINT 0.5mm Dia  [Test-point - 0.5mm]  (value not drawn)  (no BOM)
TP4  TEST POINT 0.5mm Dia  [Test-point - 0.5mm]  (value not drawn)  (no BOM)
TP5  TEST POINT 0.5mm Dia  [Test-point - 0.5mm]  (value not drawn)  (no BOM)
TP6  TEST POINT 0.5mm Dia  [Test-point - 0.5mm]  (value not drawn)  (no BOM)
TP7  TEST POINT 0.5mm Dia  [Test-point - 0.5mm]  (value not drawn)  (no BOM)
TP8  TEST POINT 0.5mm Dia  [Test-point - 0.5mm]  (value not drawn)  (no BOM)
TP9  TEST POINT 0.5mm Dia  [Test-point - 0.5mm]  (value not drawn)  (no BOM)
TP10  TEST POINT 0.5mm Dia  [Test-point - 0.5mm]  (value not drawn)  (no BOM)
TP11  2 Test Pad  [2 Test Pad]  (no BOM)
U3  TPS63002DRCR  [10-VSON (3x3)]
U4  TLV493DA2BWXTMA1  [WLCSP-5(0.9x1.1)]
U5  NRF52840-QIAA-R7  [73-QFN (7x7)]
X1  32MHz  [SMD2016-4P]

### Ports
+3V3, +5V, BAT STATUS READ, BAT_nRF, GND, GNSS (bidir, harness GNSS), IMU (bidir, harness IMU), MCU_3V3_EN, PWR_SW_SENSE, SCL2, SDA2, UWB (bidir, harness UWB), VBATT

### Harnesses
UWB: GPIO0, GPIO1, GPIO2, GPIO3, GPIO4, GPIO5, GPIO6, WAKEUP, EXTON, SPICsn, SPIMOSI, SPIMISO, SPICLK, IRQ, RSTn, SYNC
GNSS: SDA, SCL, EXTINT0, PPS, TXD_SPIMISO, RXD_SPIMOSI
IMU: SCL, SDA, INTB, INT2, INT3, INT4

### Nets
5V_BOOST: C13.2 C24.2 C32.1 C33.1 C34.1 LED1.2(VDD) LED2.2(VDD) LED3.2(VDD) R16.1 U3.1(VOUT) U3.10(FB)
+3V3: C14.2 C20.1 J4.01 Q1.1(G) R13.2 R14.2 R15.2 R17.1 U4.C3(VDD) U5.A22(VDD) U5.AD14(VDD) U5.AD23(VDD) U5.B1(VDD) U5.W1(VDD) U5.Y2(VDDH) ; port +3V3  [project net VDDAON]
+5V: C22.1 U5.AD2(VBUS) ; port +5V
GND: C11.1 C12.1 C13.1 C14.1 C15.2 C16.2 C17.1 C18.1 C19.1 C20.2 C21.2 C22.2 C23.2 C24.1 C25.2 C26.1 C28.1 C29.1 C30.1 C31.2 C32.2 C33.2 C34.2 C35.1 D2.2(GND) D6.1(A) J4.03 J4.05 LED1.4(VSS) LED2.4(VSS) LED3.4(VSS) R10.1 R30.2 TP10.1 U3.3(PGND) U3.9(GND) U3.11(GND) U4.C1(GND) U5.74(VSS) U5.B7(VSS) U5.F23(VSS_PA) X1.2(GND) X1.4(GND) ; port GND
VBATT: R11.2 ; port VBATT
VBATT/5V: C11.2 C12.2 R9.2 U3.5(VIN)
BAT STATUS READ: U5.H2(P0.27) ; port BAT STATUS READ
BAT_nRF: U5.V23(P1.03) ; port BAT_nRF
BATT_ADC: C26.2 D6.2(K) R11.1 R30.1 U5.K2(P0.05/AIN3)
BOOST_ENABLE: R10.2 U3.6(EN) U5.J1(P0.04/AIN2)
DEC3: C19.2 U5.D23(DEC3)
DEC4_6: C15.1 C18.2 U5.B5(DEC4) U5.E24(DEC6)
EXTINT0: U5.AC11(P0.16) ; port GNSS.EXTINT0
EXTON: U5.AC19(P0.23) ; port UWB.EXTON
GPIO0: U5.B19(P1.11) ; port UWB.GPIO0
GPIO1: U5.A16(P1.13) ; port UWB.GPIO1
GPIO2: U5.AD10(P0.15) ; port UWB.GPIO2
GPIO3: U5.AD8(P0.13) ; port UWB.GPIO3
GPIO4: U5.Y23(P1.01) ; port UWB.GPIO4
GPIO5: U5.U24(P1.04) ; port UWB.GPIO5
GPIO6: U5.P2(P1.08) ; port UWB.GPIO6
INT2: U5.A12(P0.02/AIN0) ; port IMU.INT2
INT3: U5.N1(P0.08) ; port IMU.INT3
INT4: U5.AD18(P0.22) ; port IMU.INT4
INTB: R13.1 U4.A1(INT#) U5.AC21(P0.25) ; port IMU.INTB
IRQ: U5.P23(P1.07) ; port UWB.IRQ
LED_DIN_3V3: Q1.2(S) R17.2 U5.B11(P0.28/AIN4)
LED_DIN_5V: R18.2 R28.1
MCU_3V3_EN: U5.A10(P0.29/AIN5) ; port MCU_3V3_EN
P0.07_TRACECLK: TP6.1 U5.M2(P0.07/TRACECLK)
P0.11_TRACEDATA2: TP4.1 U5.T2(P0.11/TRACEDATA2)
P0.12_TRACEDATA1: TP3.1 U5.U1(P0.12/TRACEDATA1)
P1.00_TRACEDATA0/SWO: D2.1(I/01) J4.06 TP5.1 U5.AD22(P1.00/TRACEDATA0)
P1.09_TRACEDATA3: TP2.1 U5.R1(P1.09/TRACEDATA3)
PPS: U5.B13(P0.03/AIN1) ; port GNSS.PPS
PWR_SW_SENSE: U5.AC15(P0.19) ; port PWR_SW_SENSE
RESET: D2.5(I/04) R12.1 TP9.1 U5.AC13(P0.18/NRESET)
RSTn: U5.T23(P1.05) ; port UWB.RSTn
RXD_SPIMOSI: U5.R24(P1.06) ; port GNSS.RXD_SPIMOSI
SCL: R15.1 U4.B2(SCL) U5.B15(P1.14) ; port GNSS.SCL, port IMU.SCL
SCL2: U5.D2(P0.00/XL1) ; port SCL2
SDA: R14.1 U4.A3(SDA) U5.A20(P1.10) ; port GNSS.SDA, port IMU.SDA
SDA2: U5.F2(P0.01/XL2) ; port SDA2
SPICLK: U5.AC9(P0.14) ; port UWB.SPICLK
SPICSN: U5.AC17(P0.21) ; port UWB.SPICsn
SPIMISO: U5.AD12(P0.17) ; port UWB.SPIMISO
SPIMOSI: U5.AD16(P0.20) ; port UWB.SPIMOSI
SWDCLK: D2.3(I/02) J4.04 TP8.1 U5.AA24(SWDCLK)
SWDIO: D2.4(I/03) J4.02 TP7.1 U5.AC24(SWDIO)
SYNC: U5.W24(P1.02) ; port UWB.SYNC
TXD_SPIMISO: U5.J24(P0.10/NFC2) ; port GNSS.TXD_SPIMISO
WAKEUP: U5.AD20(P0.24) ; port UWB.WAKEUP
XC1: C30.2 U5.B24(XC1) X1.1(IN/OUT)
XC2: C31.1 U5.A23(XC2) X1.3(Out/In)
NetANT1_1: ANT1.1(FEED) C29.2 C35.2 L3.1
NetC16_1: C16.1 U5.AC5(DECUSB)
NetC17_2: C17.2 U5.N24(DEC5)
NetC21_1: C21.1 U5.A18(DEC2)
NetC23_1: C23.1 U5.C1(DEC1)
NetC25_1: C25.1 R9.1 U3.7(PS/SYNC) U3.8(VINA)
NetC28_2: C28.2 L3.2 U5.H23(ANT)
NetJ4_10: J4.10 R12.2
NetL2_1: L2.1 U3.4(L1)
NetL2_2: L2.2 U3.2(L2)
NetLED1_1: LED1.1(DIN) R18.1
NetLED1_3: LED1.3(DOUT) LED2.1(DIN)
NetLED2_3: LED2.3(DOUT) LED3.1(DIN)
NetQ1_3: Q1.3(D) R16.2 R28.2
NetTP11_1: TP11.1 U5.AD6(D+)
NetTP11_2: TP11.2 U5.AD4(D-)

Not connected (* = marked no-connect by the designer): ANT1 2(NC)*; J4 07* 08* 09*; LED3 3(DOUT)*; U5 A8(P0.31/AIN7)* A14(P1.15)* AB2(DCCH)* B3(DCC)* B9(P0.30/AIN6)* B17(P1.12)* G1(P0.26)* L1(P0.06)* L24(P0.09/NFC1)*

### Notes on the sheet
- MCU
- I2C PULL UP's
- MAGNETOMETER
- TESTPOINTS
- (near L2) BOOST CONVERTER
- JTAG/SWD
- RGB LED
- 3.3V to 5V Level Shifter
- BATT_VSENSE
- R11 and R30 are optional and intended for BATT level sense
- File:
- Title:
- Date:
- Page
- Num:
- Total:
- Drawn By: Huzaifa Ali